# Altium schematic sheet Indicator.SchDoc
size A; DocumentNumber: 13; SheetNumber: 13; SheetTotal: 14
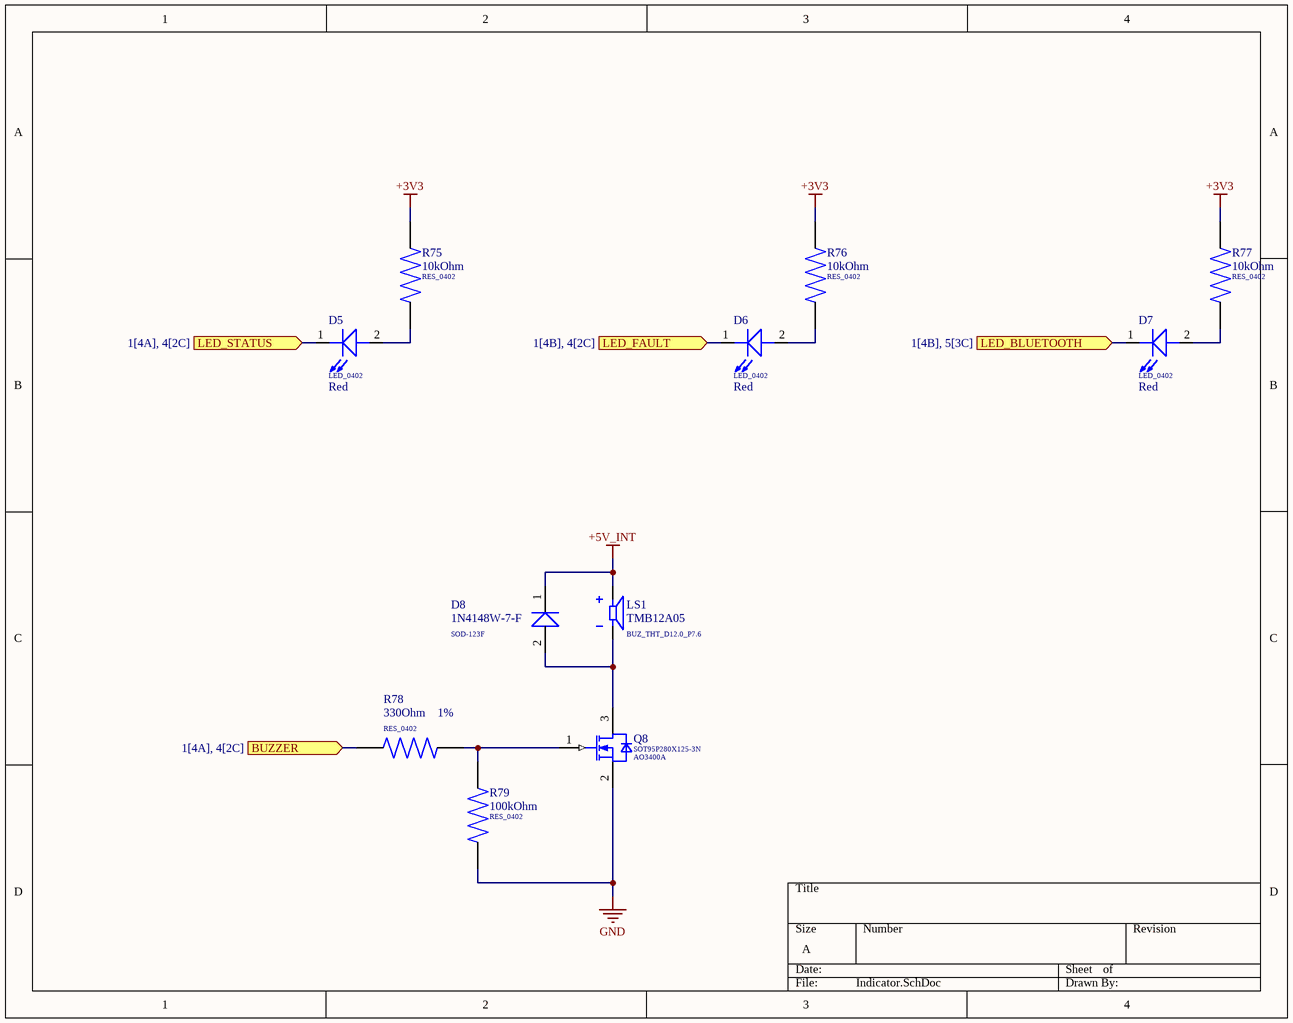
[diagram p0: Indicator.SchDoc]

## Parts
D5  LED_0402  Color: Red  [LED_0402]
D6  LED_0402  Color: Red  [LED_0402]
D7  LED_0402  Color: Red  [LED_0402]
D8  SOD-123F  MPN: 1N4148W-7-F  [SOD-123F]
LS1  BUZ_THT_D12.0_P7.6  MPN: TMB12A05  [BUZ_THT_D12.0_P7.6]
Q8  SOT95P280X125-3N  MPN: AO3400A  [SOT95P280X125-3N]
R75  RES_0402  value 10kOhm  [RES_0402]
R76  RES_0402  value 10kOhm  [RES_0402]
R77  RES_0402  value 10kOhm  [RES_0402]
R78  RES_0402  value 330Ohm  Tolerance: 1%  [RES_0402]
R79  RES_0402  value 100kOhm  [RES_0402]

## Ports
BUZZER (in, see 1[4A], 4[2C]), LED_BLUETOOTH (in, see 1[4B], 5[3C]), LED_FAULT (in, see 1[4B], 4[2C]), LED_STATUS (in, see 1[4A], 4[2C])

## Nets
+3V3: R75.1 R76.1 R77.1
+5V_INT: D8.1(K) LS1.P
GND: Q8.2(SOURCE) R79.1
BUZZER: R78.2 ; port BUZZER
LED_BLUETOOTH: D7.1(K) ; port LED_BLUETOOTH
LED_FAULT: D6.1(K) ; port LED_FAULT
LED_STATUS: D5.1(K) ; port LED_STATUS
NetD5_2: D5.2(A) R75.2
NetD6_2: D6.2(A) R76.2
NetD7_2: D7.2(A) R77.2
NetD8_2: D8.2(A) LS1.N Q8.3(DRAIN)
NetQ8_1: Q8.1(GATE) R78.1 R79.2

## Library data of the parts
D5-D7 = LED: GENERIC LED; MPN: *; Vf (Typ): *; Package: *; LCSC Part Number: C25503345; If (Max): *; MF: *
D8 = DIODE: GENERIC DIODE; Pd (Max): *; LCSC Part Number: C83528; Vf (Max): *; If (Avg): *; Vr (Max): *; MF: *
LS1 = BUZZER: GENERIC BUZZER; SPL: 85dB; MF: *; Type: Active Buzzer; LCSC Part Number: C96093
Q8 = NMOS_GSD: GENERIC N-MOSFET 1=G, 2=S, 3=D; Channel Type: P-Channel; LCSC Part Number: C20917; Vds (Max): *; Id (Max): *; Vgs(th): *; MF: *; Rds(on) (Max): *
R75-R77 R79 = RES: GENERIC RES; Tolerance: 1%; Power Rating: *; MPN: *; Rated Voltage: *; Temperature Coefficient: *
  R75-R77: LCSC Part Number: C60490
  R79: LCSC Part Number: C60491
R78 = RES: GENERIC RES; MPN: RC0402FR-07330RL; Power Rating: *; Rated Voltage: *; Temperature Coefficient: *; LCSC Part Number: C105875